# EAGLE design Sirokko (EAGLE 9.7.0)
Sirokko 262.01 controller: ESP32-S3, sensor interfaces, 12/24 V supply and relay outputs.

## Sheet 1 of 2: ESP32-S3 and sensor interfaces
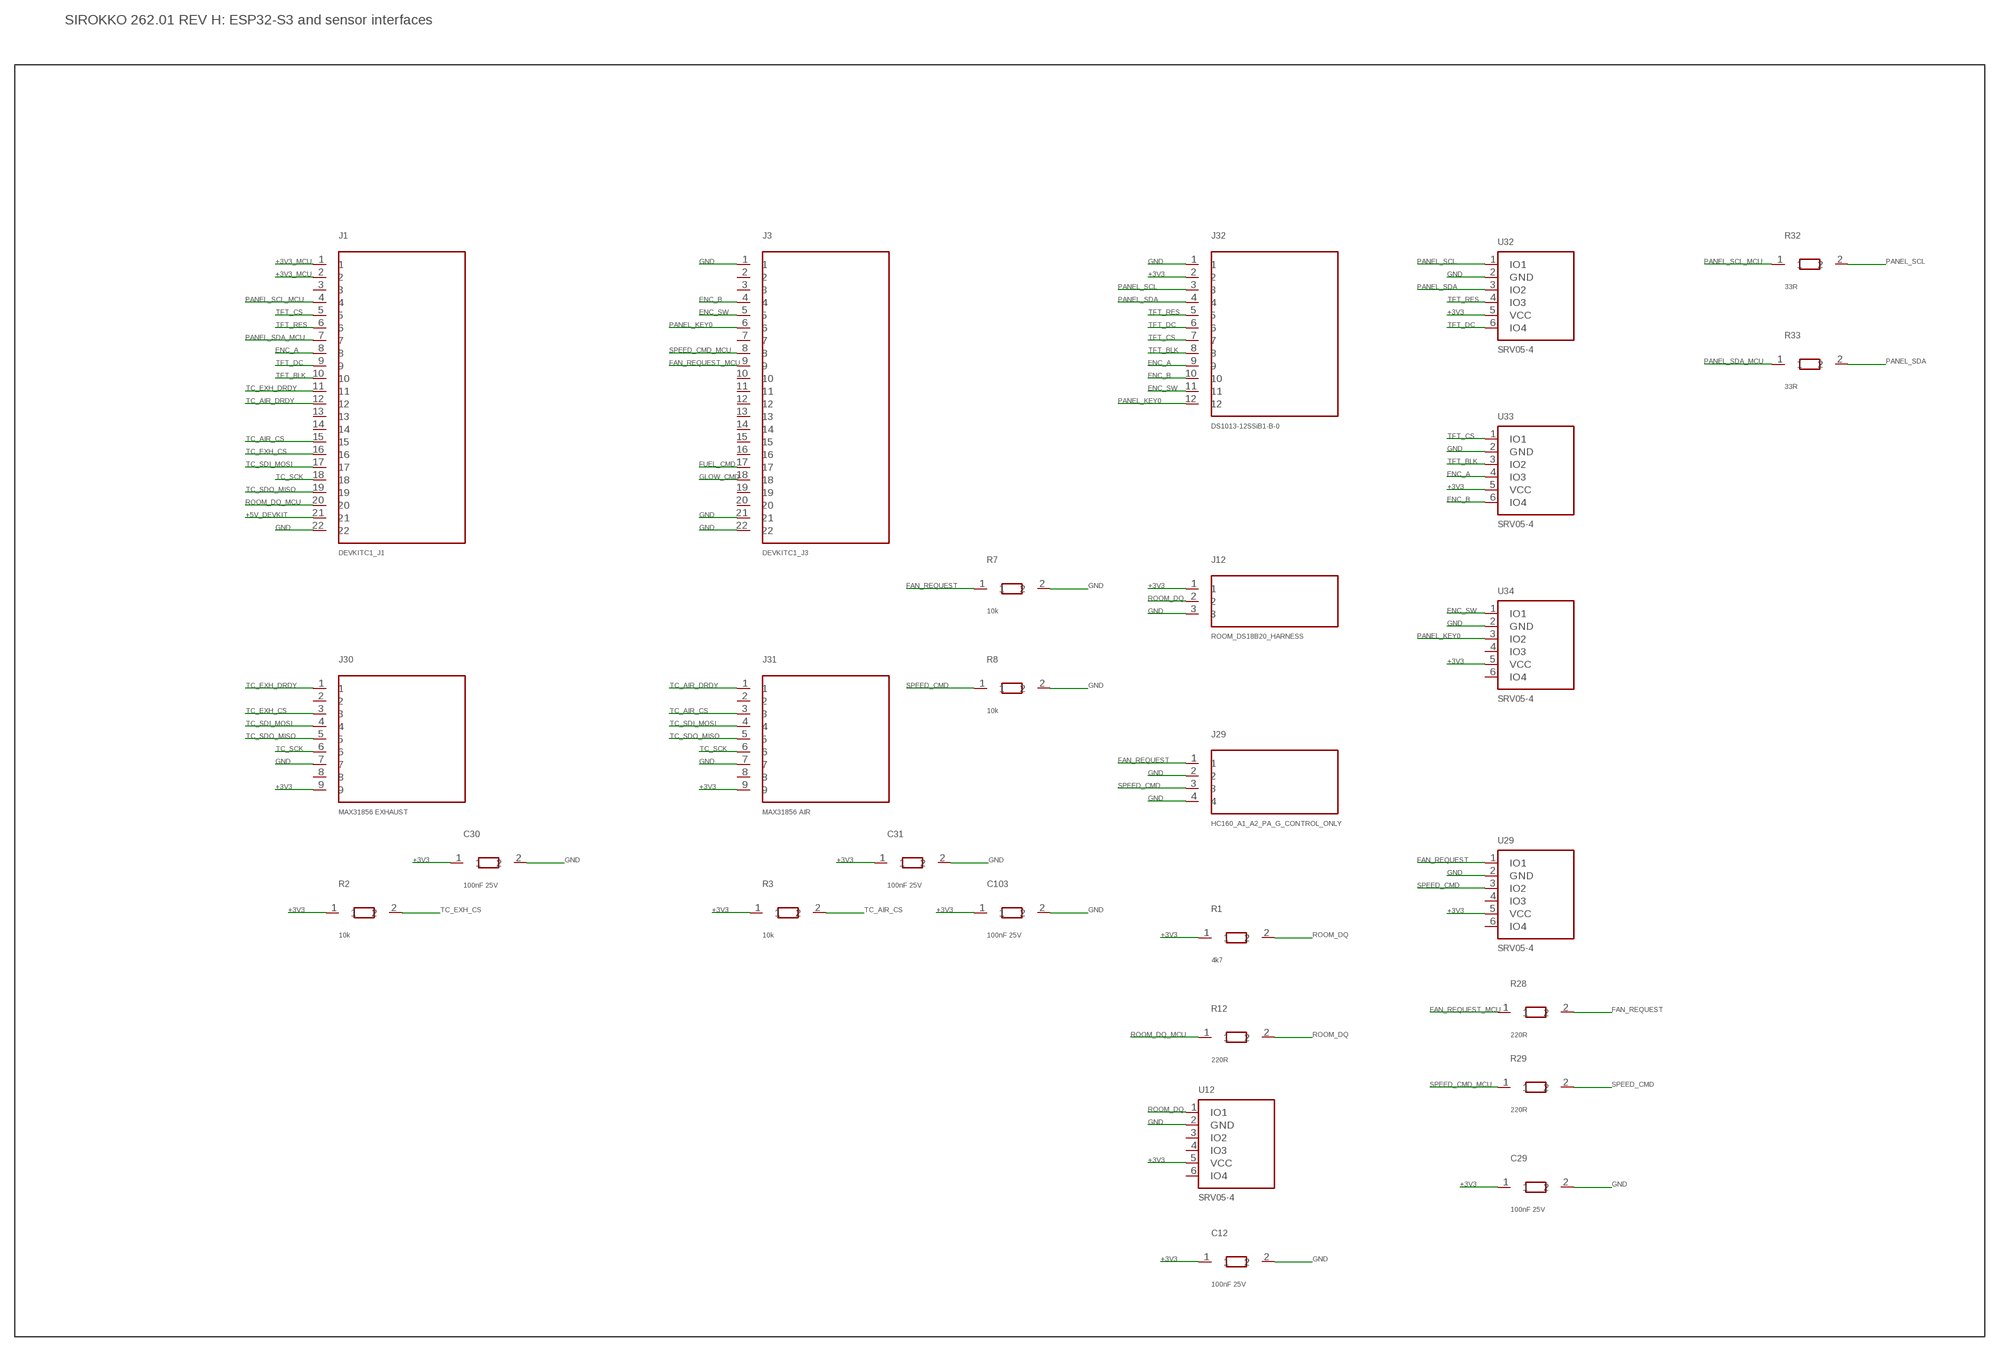
[diagram p0: schematic, sheet 1]

### Parts
C12  100nF 25V  C0805  [C0805]
C29  100nF 25V  C0805  [C0805]
C30  100nF 25V  C0805  [C0805]
C31  100nF 25V  C0805  [C0805]
C103  100nF 25V  C0805  [C0805]
J1  DEVKITC1_J1  CONN_22  [SOCKET_1X22_P2.54]
J3  DEVKITC1_J3  CONN_22  [SOCKET_1X22_P2.54]
J12  ROOM_DS18B20_HARNESS  CONN_3  [TERM_5.08_3]
J29  HC160_A1_A2_PA_G_CONTROL_ONLY  CONN_4  [TERM_5.08_4]
J30  MAX31856 EXHAUST  CONN_9  [SOCKET_MAX31856]
J31  MAX31856 AIR  CONN_9  [SOCKET_MAX31856]
J32  DS1013-12SSiB1-B-0  DS1013_12SSIB1  [DS1013_12SSIB1]
R1  4k7  R0805  [R0805]
R2  10k  R0805  [R0805]
R3  10k  R0805  [R0805]
R7  10k  R0805  [R0805]
R8  10k  R0805  [R0805]
R12  220R  R0805  [R0805]
R28  220R  R0805  [R0805]
R29  220R  R0805  [R0805]
R32  33R  R0805  [R0805]
R33  33R  R0805  [R0805]
U12  SRV05-4  SRV05  [SRV05_SOT23_6]
U29  SRV05-4  SRV05  [SRV05_SOT23_6]
U32  SRV05-4  SRV05  [SRV05_SOT23_6]
U33  SRV05-4  SRV05  [SRV05_SOT23_6]
U34  SRV05-4  SRV05  [SRV05_SOT23_6]

### Nets
+3V3: C12.1 C29.1 C30.1 C31.1 C103.1 J12.1 J30.9 J31.9 J32.2 R1.1 R2.1 R3.1 U12.5(VCC) U29.5(VCC) U32.5(VCC) U33.5(VCC) U34.5(VCC) ; also sheet 2
+3V3_MCU: J1.1 J1.2
+5V_DEVKIT: J1.21 ; also sheet 2
ENC_A: J1.8 J32.9 U33.4(IO3)
ENC_B: J3.4 J32.10 U33.6(IO4)
ENC_SW: J3.5 J32.11 U34.1(IO1)
FAN_REQUEST: J29.1 R7.1 R28.2 U29.1(IO1)
FAN_REQUEST_MCU: J3.9 R28.1
FUEL_CMD: J3.17 ; also sheet 2
GLOW_CMD: J3.18 ; also sheet 2
GND: C12.2 C29.2 C30.2 C31.2 C103.2 J1.22 J3.1 J3.21 J3.22 J12.3 J29.2 J29.4 J30.7 J31.7 J32.1 R7.2 R8.2 U12.2(GND) U29.2(GND) U32.2(GND) U33.2(GND) U34.2(GND) ; also sheet 2
PANEL_KEY0: J3.6 J32.12 U34.3(IO2)
PANEL_SCL: J32.3 R32.2 U32.1(IO1)
PANEL_SCL_MCU: J1.4 R32.1
PANEL_SDA: J32.4 R33.2 U32.3(IO2)
PANEL_SDA_MCU: J1.7 R33.1
ROOM_DQ: J12.2 R1.2 R12.2 U12.1(IO1)
ROOM_DQ_MCU: J1.20 R12.1
SPEED_CMD: J29.3 R8.1 R29.2 U29.3(IO2)
SPEED_CMD_MCU: J3.8 R29.1
TC_AIR_CS: J1.15 J31.3 R3.2
TC_AIR_DRDY: J1.12 J31.1
TC_EXH_CS: J1.16 J30.3 R2.2
TC_EXH_DRDY: J1.11 J30.1
TC_SCK: J1.18 J30.6 J31.6
TC_SDI_MOSI: J1.17 J30.4 J31.4
TC_SDO_MISO: J1.19 J30.5 J31.5
TFT_BLK: J1.10 J32.8 U33.3(IO2)
TFT_CS: J1.5 J32.7 U33.1(IO1)
TFT_DC: J1.9 J32.6 U32.6(IO4)
TFT_RES: J1.6 J32.5 U32.4(IO3)
Unconnected: J1.3 J1.13 J1.14 J3.2 J3.3 J3.7 J3.10 J3.11 J3.12 J3.13 J3.14 J3.15 J3.16 J3.19 J3.20 J30.2 J30.8 J31.2 J31.8 U12.3(IO2) U12.4(IO3) U12.6(IO4) U29.4(IO3) U29.6(IO4) U34.4(IO3) U34.6(IO4)

### Notes on the sheet
- SIROKKO 262.01 REV H: ESP32-S3 and sensor interfaces

## Sheet 2 of 2: Power supply and relay outputs
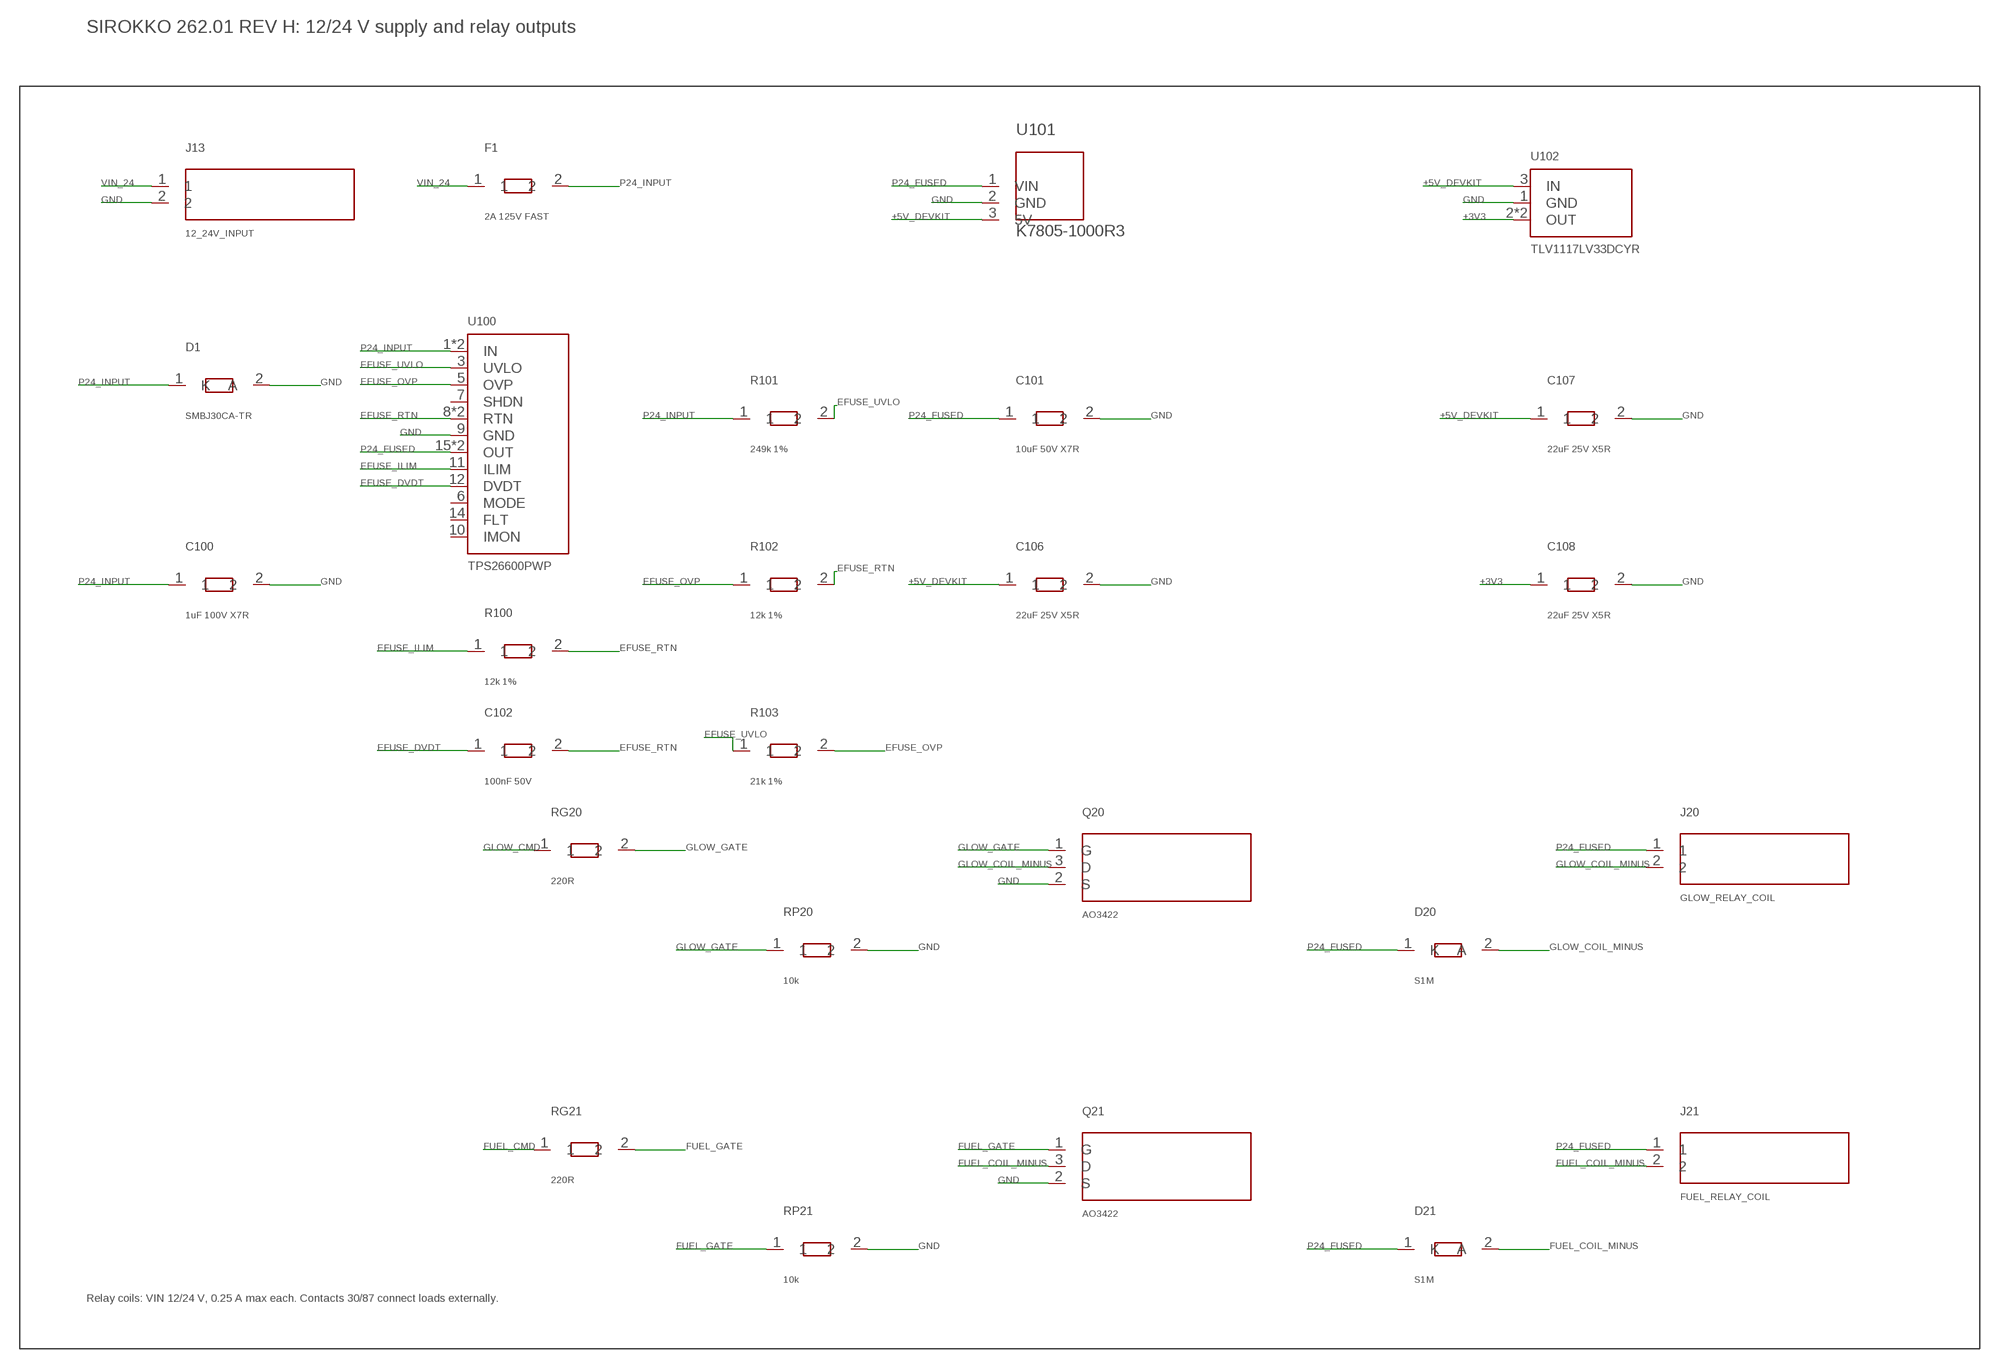
[diagram p1: schematic, sheet 2]

### Parts
C100  1uF 100V X7R  C1206  [C1206]
C101  10uF 50V X7R  C1210  [C1210]
C102  100nF 50V  C1206  [C1206]
C106  22uF 25V X5R  C1206  [C1206]
C107  22uF 25V X5R  C1206  [C1206]
C108  22uF 25V X5R  C1206  [C1206]
D1  SMBJ30CA-TR  SMB  [SMB]
D20  S1M  SMA  [SMA]
D21  S1M  SMA  [SMA]
F1  2A 125V FAST  FUSE2410  [FUSE2410]
J13  12_24V_INPUT  CONN_2  [TERM_5.08_2]
J20  GLOW_RELAY_COIL  CONN_2  [TERM_5.08_2]
J21  FUEL_RELAY_COIL  CONN_2  [TERM_5.08_2]
Q20  AO3422  [AO3422_SOT23]
Q21  AO3422  [AO3422_SOT23]
R100  12k 1%  R0805  [R0805]
R101  249k 1%  R0805  [R0805]
R102  12k 1%  R0805  [R0805]
R103  21k 1%  R0805  [R0805]
RG20  220R  R0805  [R0805]
RG21  220R  R0805  [R0805]
RP20  10k  R0805  [R0805]
RP21  10k  R0805  [R0805]
U100  TPS26600PWP  TPS26600  [TPS26600_PWP]
U101  K7805-1000R3  K7805_1000R3  [K7805_1000R3]
U102  TLV1117LV33DCYR  TLV1117LV33  [TLV1117LV_DCY]

### Nets
+3V3: C108.1 U102.2(OUT) U102.4(OUT) ; also sheet 1
+5V_DEVKIT: C106.1 C107.1 U101.3(5V) U102.3(IN) ; also sheet 1
EFUSE_DVDT: C102.1 U100.12(DVDT)
EFUSE_ILIM: R100.1 U100.11(ILIM)
EFUSE_OVP: R102.1 R103.2 U100.5(OVP)
EFUSE_RTN: C102.2 R100.2 R102.2 U100.8(RTN) U100.17(RTN)
EFUSE_UVLO: R101.2 R103.1 U100.3(UVLO)
FUEL_CMD: RG21.1 ; also sheet 1
FUEL_COIL_MINUS: D21.2(A) J21.2 Q21.3(D)
FUEL_GATE: Q21.1(G) RG21.2 RP21.1
GLOW_CMD: RG20.1 ; also sheet 1
GLOW_COIL_MINUS: D20.2(A) J20.2 Q20.3(D)
GLOW_GATE: Q20.1(G) RG20.2 RP20.1
GND: C100.2 C101.2 C106.2 C107.2 C108.2 D1.2(A) J13.2 Q20.2(S) Q21.2(S) RP20.2 RP21.2 U100.9(GND) U101.2(GND) U102.1(GND) ; also sheet 1
P24_FUSED: C101.1 D20.1(K) D21.1(K) J20.1 J21.1 U100.15(OUT) U100.16(OUT) U101.1(VIN)
P24_INPUT: C100.1 D1.1(K) F1.2 R101.1 U100.1(IN) U100.2(IN)
VIN_24: F1.1 J13.1
Unconnected: U100.6(MODE) U100.7(SHDN) U100.10(IMON) U100.14(FLT)

### Notes on the sheet
- SIROKKO 262.01 REV H: 12/24 V supply and relay outputs
- Relay coils: VIN 12/24 V, 0.25 A max each. Contacts 30/87 connect loads externally.

## Library data of the parts
C12 C29-C31 C103 = Sirokko:C0805; MPN: CC0805KRX7R8BB104; SUPPLIER_URL: https://www.chipdip.ru/product/0.1mkf-x7r-25v-10-0805-cc0805krx7r8bb104-kondensator-yageo-9000066545
C100 = Sirokko:C1206; MPN: CC1206KKX7R0BB105; SUPPLIER_URL: https://www.chipdip.ru/product/1mkf-x7r-100v-10-1206-cc1206kkx7r0bb105-kondensator-yageo-9000337923
C101 = Sirokko:C1210; MPN: GRM32ER71H106KA12L; SUPPLIER_URL: https://www.chipdip.ru/product/10mkf-x7r-50v-10-1210-grm32er71h106k-kondensator-murata-9000141173
C102 = Sirokko:C1206; MPN: CL31B104KBCNNNC; SUPPLIER_URL: https://www.chipdip.ru/product/0.1mkf-x7r-50v-10-1206-cl31b104kbcnnnc-kondensator-samsung-9000768544
C106-C108 = Sirokko:C1206; MPN: CL31A226KAHNNNE; SUPPLIER_URL: https://www.chipdip.ru/product/22mkf-x5r-25v-10-1206-cl31a226kahnnne-kondensator-samsung-9000413179
D1 = Sirokko:SMB; MPN: SMBJ30CA-TR; SUPPLIER_URL: https://www.chipdip.ru/product/smbj30ca-tr-diod-zaschitnyy-600vt-30v-st-microelectronics-9000484595
D20 D21 = Sirokko:SMA; MPN: S1M-13-F; SUPPLIER_URL: https://www.chipdip.ru/product/s1m-13-f-diod-vypryamitelnyy-1a-100v-sma-do-214ac-diodes-9000394670
F1 = Sirokko:FUSE2410; MPN: 0451002.MRL; SUPPLIER_URL: https://www.chipdip.ru/product/0451002-mrl-2a-125v-2410-predohranitel-smd-littelfuse-9000161728
J1 J3 = Sirokko:CONN_22; MPN: DS1023-1x40; SUPPLIER_URL: https://www.chipdip.ru/product/pbs-40-ds1023-1x40-gnezdo-na-platu-2.54mm-1x40pin-pryamoe-connfly-8935
J12 = Sirokko:CONN_3; MPN: DG127-5.08-03P-14-1000Z(H); SUPPLIER_URL: https://www.chipdip.ru/product/dg127-5.08-03p-14-1000z-h-klemmnik-dg127-5.08-degson-8076133255
J13 J20 J21 = Sirokko:CONN_2; MPN: DG127-5.08-02P-14-00A(H); SUPPLIER_URL: https://www.chipdip.ru/product/dg127-5.08-02p-14-00a-h-klemmnik-degson-8007163023
J29 = Sirokko:CONN_4; MPN: DG127-5.08-02P-14-00A(H); SUPPLIER_URL: https://www.chipdip.ru/product/dg127-5.08-02p-14-00a-h-klemmnik-degson-8007163023
J30 J31 = Sirokko:CONN_9; MPN: DS1023-1x40; SUPPLIER_URL: https://www.chipdip.ru/product/pbs-40-ds1023-1x40-gnezdo-na-platu-2.54mm-1x40pin-pryamoe-connfly-8935
J32 = Sirokko-parts:DS1013_12SSIB1; MPN: DS1013-12SSiB1-B-0; SUPPLIER_URL: https://www.chipdip.ru/product/idc-12m-ds1013-12-vilka-2.54mm-na-platu-12pin-connfly-9000386091
Q20 Q21 = Sirokko-parts:AO3422; MPN: AO3422; SUPPLIER_URL: https://www.chipdip.ru/product/ao3422-tranzistor-n-mosfet-55v-2.1a-1.25vt-alpha-omega-9000604823
R1 = Sirokko:R0805; MPN: RC0805FR-074K7L; SUPPLIER_URL: https://www.chipdip.ru/product/0.125vt-0805-4.7-kom-1-rc0805fr-074k7l-chip-rezistor-yageo-9000350078
R2 R3 R7 R8 RP20 RP21 = Sirokko:R0805; MPN: RC0805FR-0710KL; SUPPLIER_URL: https://www.chipdip.ru/product/0.125vt-0805-10-kom-1-rc0805fr-0710kl-chip-rezistor-yageo-9000272499
R12 R28 R29 RG20 RG21 = Sirokko:R0805; MPN: RC0805FR-07220RL; SUPPLIER_URL: https://www.chipdip.ru/product/0.125vt-0805-220-om-1-rc0805fr-07220rl-chip-rezistor-yageo-9000393930
R32 R33 = Sirokko:R0805; MPN: RC0805FR-0733RL; SUPPLIER_URL: https://www.chipdip.ru/product/rc0805fr-0733rl-yageo-8001790284
R100 R102 = Sirokko:R0805; MPN: RC0805FR-0712KL; SUPPLIER_URL: https://www.chipdip.ru/product/0.125vt-0805-12-kom-1-rc0805fr-0712kl-chip-rezistor-yageo-9001512277
R101 = Sirokko:R0805; MPN: RC0805FR-07249KL; SUPPLIER_URL: https://www.chipdip.ru/product/rc0805fr-07249kl-rezistor-yageo-9000374189
R103 = Sirokko:R0805; MPN: RC0805FR-0721KL; SUPPLIER_URL: https://www.chipdip.ru/product/rc0805fr-0721kl-yageo-8001794514
U12 U29 U32-U34 = Sirokko-parts:SRV05; DATASHEET: https://static.chipdip.ru/lib/303/DOC021303379.pdf; MPN: SRV05-4.TCT; SUPPLIER_URL: https://www.chipdip.ru/product/srv05-4-tct-ustroystvo-zaschity-usb-ot-esd-sborka-umw-9001106217
U100 = Sirokko-parts:TPS26600; DATASHEET: https://www.ti.com/lit/ds/symlink/tps2660.pdf; MPN: TPS26600PWP; SUPPLIER_URL: https://www.chipdip.ru/product/tps26600pwp-texas-instruments-8003870507
U101 = Sirokko-parts:K7805_1000R3; MPN: K7805-1000R3; SUPPLIER_URL: https://www.chipdip.ru/product/k7805-1000r3-dc-dc-preobrazovatel-5vt-vhod-8-36v-mornsun-9000541503
U102 = Sirokko-parts:TLV1117LV33; DATASHEET: https://www.ti.com/lit/ds/symlink/tlv1117lv.pdf; MPN: TLV1117LV33DCYR; SUPPLIER_URL: https://www.chipdip.ru/product/tlv1117lv33dcyr-stabilizator-texas-instruments-9001599934

## Net classes
0 Default: width 0.2 mm, drill 0.3 mm, clearance 0.2 mm

## Board
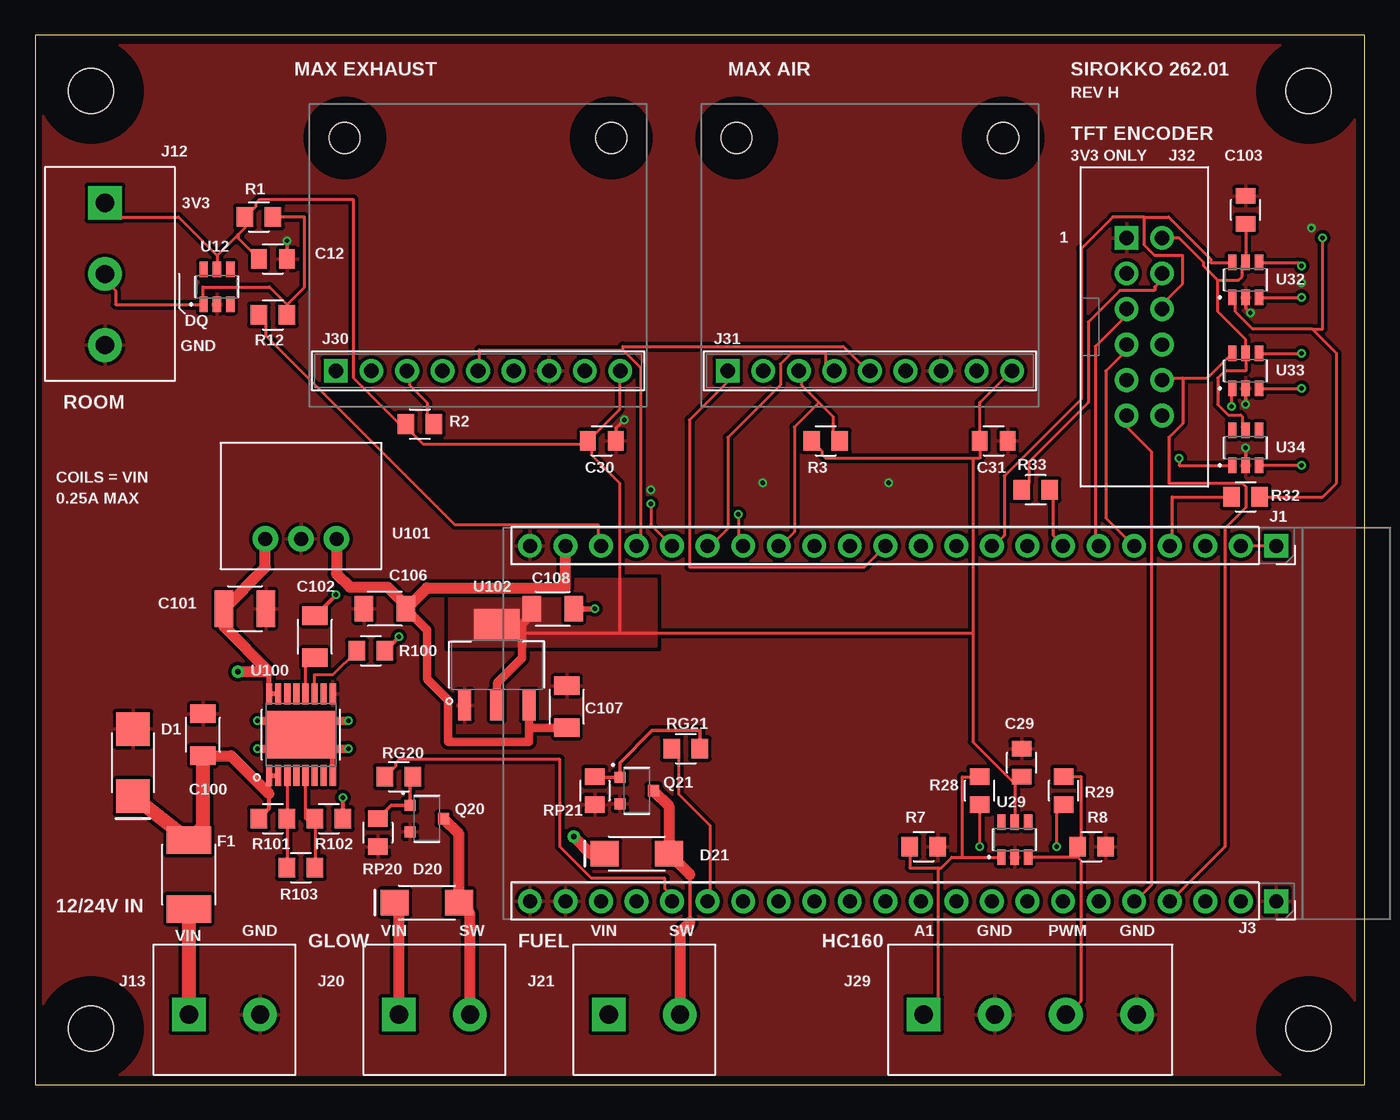
[diagram p2: board, top side]
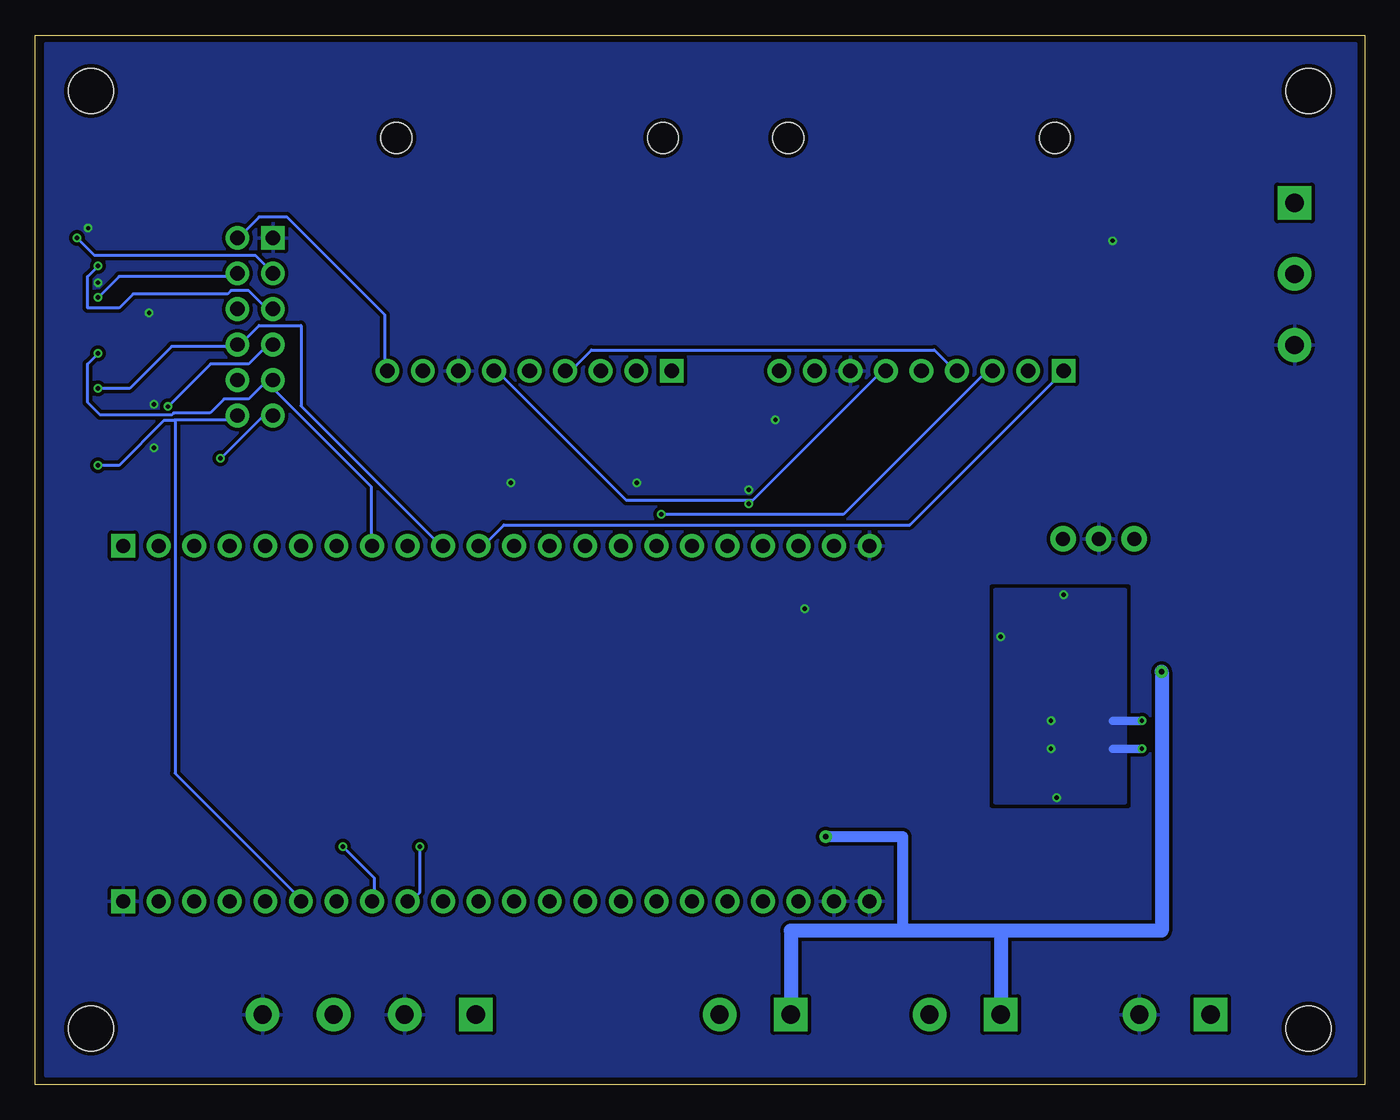
[diagram p3: board, bottom side, seen from below]

Size 95 x 75 mm. Coordinates in mm from the lower left corner, seen from the top.
Outline: 0,0 95,0 95,75 0,75 0,0
Copper layers (1*16): Top 0.035mm / dielectric 1.5mm / Bottom 0.035mm
Design rules "Sirokko.edru": minimum track width 0.2mm, minimum drill 0.3mm, track to track 0.2mm, track to pad 0.2mm, pad to pad 0.2mm, via to via 0.2mm, smd to smd 0.2mm, copper to edge 0.3mm, drill to drill 0.25mm, minimum pad ring 0.1mm, minimum via ring 0.15mm, stop-mask expansion 0.04mm, vias tented up to drill 32mil, thermal gap 10mil
Holes 3.2 mm at 91,4 4,71 91,71 4,4
Holes 2.2 mm at 22.14,67.64 41.19,67.64 50.13,67.64 69.19,67.64
tRestrict: area 87.5,0.5 to 94.5,7.5; area 0.5,67.5 to 7.5,74.5; area 87.5,67.5 to 94.5,74.5; area 19.4,64.9 to 24.8,70.3; area 38.5,64.9 to 43.9,70.3; area 47.4,64.9 to 52.8,70.3; area 66.5,64.9 to 71.9,70.3; area 0.5,0.5 to 7.5,7.5
vRestrict: area 87.5,0.5 to 94.5,7.5; area 0.5,67.5 to 7.5,74.5; area 87.5,67.5 to 94.5,74.5; area 19.4,64.9 to 24.8,70.3; area 38.5,64.9 to 43.9,70.3; area 47.4,64.9 to 52.8,70.3; area 66.5,64.9 to 71.9,70.3; area 0.5,0.5 to 7.5,7.5

### Footprints (pad centres in the part's own frame; a part is rotated, then mirrored left to right if it is on the bottom)
C0805 = smd 1.1 x 1.4: 1 -1,0; 2 1,0
C1206 = smd 1.3 x 1.8: 1 -1.5,0; 2 1.5,0
C1210 = smd 1.3 x 2.6: 1 -1.5,0; 2 1.5,0
SMB = smd 2.4 x 2.4: 1 -2.4,0; 2 2.4,0
SMA = smd 2 x 1.8: 1 -2.3,0; 2 2.3,0
FUSE2410 = smd 1.96 x 3.15: 1 -2.455,0; 2 2.455,0
SOCKET_1X22_P2.54 = drill 1 pad 1.7 square: 1 0,0 | drill 1 pad 1.7: 2 0,-2.54; 3 0,-5.08; 4 0,-7.62; 5 0,-10.16; 6 0,-12.7; 7 0,-15.24; 8 0,-17.78; 9 0,-20.32; 10 0,-22.86; 11 0,-25.4; 12 0,-27.94; 13 0,-30.48; 14 0,-33.02; 15 0,-35.56; 16 0,-38.1; 17 0,-40.64; 18 0,-43.18; 19 0,-45.72; 20 0,-48.26; 21 0,-50.8; 22 0,-53.34
TERM_5.08_3 = drill 1.3 pad 2.4 square: 1 0,0 | drill 1.3 pad 2.4: 2 5.08,0; 3 10.16,0
TERM_5.08_2 = drill 1.3 pad 2.4 square: 1 0,0 | drill 1.3 pad 2.4: 2 5.08,0
TERM_5.08_4 = drill 1.3 pad 2.4 square: 1 0,0 | drill 1.3 pad 2.4: 2 5.08,0; 3 10.16,0; 4 15.24,0
SOCKET_MAX31856 = drill 1.04 pad 1.7 square: 1 0,0 | drill 1.04 pad 1.7: 2 0,-2.54; 3 0,-5.08; 4 0,-7.62; 5 0,-10.16; 6 0,-12.7; 7 0,-15.24; 8 0,-17.78; 9 0,-20.32
DS1013_12SSIB1 = drill 1.02 pad 1.7 square: 1 0,0 | drill 1.02 pad 1.7: 2 2.54,0; 3 0,-2.54; 4 2.54,-2.54; 5 0,-5.08; 6 2.54,-5.08; 7 0,-7.62; 8 2.54,-7.62; 9 0,-10.16; 10 2.54,-10.16; 11 0,-12.7; 12 2.54,-12.7
AO3422_SOT23 = smd 0.8 x 0.8: 1 -1.2,0.95; 2 -1.2,-0.95; 3 1.2,0
R0805 = smd 1.2 x 1.4: 1 -1,0; 2 1,0
SRV05_SOT23_6 = smd 0.6 x 1.1: 1 -0.95,-1.25; 2 0,-1.25; 3 0.95,-1.25; 4 0.95,1.25; 5 0,1.25; 6 -0.95,1.25
TPS26600_PWP = smd 1.5 x 0.45: 1 -2.9,2.275; 2 -2.9,1.625; 3 -2.9,0.975; 4 -2.9,0.325; 5 -2.9,-0.325; 6 -2.9,-0.975; 7 -2.9,-1.625; 8 -2.9,-2.275; 9 2.9,-2.275; 10 2.9,-1.625; 11 2.9,-0.975; 12 2.9,-0.325; 13 2.9,0.325; 14 2.9,0.975; 15 2.9,1.625; 16 2.9,2.275 | smd 3.4 x 5: 17 0,0
K7805_1000R3 = drill 1 pad 1.8: 1 -2.54,0; 2 0,0; 3 2.54,0
TLV1117LV_DCY = smd 0.95 x 2.15: 1 -2.3,-2.9; 2 0,-2.9; 3 2.3,-2.9 | smd 3.25 x 2.15: 4 0,2.9

### Placement (x,y rotation side)
C12  17,59 0 top
C29  70.5,23 90 top
C30  40.5,46 0 top
C31  68.5,46 0 top
C100  12,25 90 top
C101  15,34 0 top
C102  20,32 90 top
C103  86.5,62.5 90 top
C106  25,34 180 top
C107  38,27 90 top
C108  37,34 0 top
D1  7,23 90 top
D20  28,13 0 top
D21  43,16.5 0 top
F1  11,15 90 top
J1  88.7,38.5 270 top
J3  88.7,13.1 270 top
J12  5,63 270 top
J13  11,5 0 top
J20  26,5 0 top
J21  41,5 0 top
J29  63.5,5 0 top
J30  21.5,51 90 top
J31  49.5,51 90 top
J32  78,60.5 0 top
Q20  28,19 0 top
Q21  43,21 0 top
R1  16,62 0 top
R2  27.5,47.2 0 top
R3  56.5,46 0 top
R7  63.5,17 0 top
R8  75.5,17 0 top
R12  17,55 0 top
R28  67.5,21 90 top
R29  73.5,21 90 top
R32  86.5,42 0 top
R33  71.5,42.5 180 top
R100  24,31 0 top
R101  17,19 0 top
R102  21,19 0 top
R103  19,15.5 0 top
RG20  26,22 0 top
RG21  46.5,24 0 top
RP20  24.5,18 270 top
RP21  40,21 270 top
U12  13,57 0 top
U29  70,17.5 0 top
U32  86.5,57.5 0 top
U33  86.5,51 0 top
U34  86.5,45.5 0 top
U100  19,25 90 top
U101  19,39 0 top
U102  33,30 0 top

### Tracks (layer width: path | path; a pad name or v marks a point on that pad's centre or on a via)
+3V3
  Top 0.2: 13,59.25 U12.5 | 14.5,60.75 15,61.25 R1.1 15.75,62.75 15.75,63 16,63.25 22.75,63.25 22.75,50.5 26,47.25 26.5,47.25 R2.1 26.5,47 27.75,45.75 39.5,45.75 C30.1 39.75,46.25 | 14.5,60.75 13,59.25 | C12.1 14.5,60.5 14.5,60.75 | 13,59.25 10.25,62 5,62 J12.1 | 39.75,46.25 41.75,48.25 41.75,51 J30.9 | 41.75,32.25 34.8,32.25 | 41.75,32.25 41.75,43 39.75,45 39.75,46.25 | C103.1 U32.5 86.25,58.5 86.25,57.75 86,57.5 84.5,57.5 | U34.5 86.25,47 86.25,47.75 86.15,47.85 85.25,47.85 84.5,48.6 84.5,50.5 85,51 86.5,51 U33.5 86.5,53.25 84.5,55.25 84.5,57.5 | J32.2 81.75,60.5 83.5,58.75 83.5,58.5 84.5,57.5 | 70,21.5 U29.5 | R3.1 56.25,45.25 56.25,45 56.5,44.75 67,44.75 | 67,44.75 67.5,44.75 C31.1 67.5,48.75 69.75,51 J31.9 | 70,21.5 67,24.5 67,32.25 | 67,44.75 67,32.25 | 70,21.5 C29.1 | 67,32.25 41.75,32.25
  Top 0.6: U102.2 33,28.7 34.8,30.5 34.8,32.25 34.8,32.9 | 34.8,32.9 U102.4 | 34.8,32.9 35.5,33.6 C108.1
  Bottom 0.2: J32.2 80.5,60.5 79,62 77,62 70,55 70,51 J31.9
  pour Top (isolate 0.25, no thermals): 29.62,31.32 44.38,31.32 44.38,36.08 29.62,36.08
+3V3_MCU
  Top 0.2: J1.1 J1.2
+5V_DEVKIT
  Top 0.6: C106.1 28,32.5 28,29 29.5,27.5 29.5,24.5 35.3,24.5 35.3,25.5 | 35.3,25.5 U102.3 | 35.3,25.5 C107.1
  Top 0.8: U101.3 21.54,36.5 22.5,35.54 25.2,35.54 26.5,34.24 C106.1 28,35.5 37.9,35.5 J1.21
EFUSE_DVDT
  Top 0.2: U100.12 19.32,29.82 C102.1
EFUSE_ILIM
  Top 0.2: U100.11 19.98,29.3 21.3,29.3 R100.1
EFUSE_OVP
  Top 0.2: U100.5 19.32,19 R102.1 R103.2
EFUSE_RTN  (via drill 0.3 pad 0.6)
  Top 0.3: R102.2 v22,20.5 | R100.2 v26,32 | C102.2 v21.5,35
  Top 0.35: U100.8 21.27,25 U100.17
  Top 0.6: v15.9,24 18,24 U100.17 | v15.9,26 18,26 U100.17 | v22.4,24 20,24 U100.17 | v22.4,26 20,26 U100.17
  Bottom 0.6: v15.9,24 18,24 | v15.9,26 18,26
  pour Bottom (isolate 0.3, no thermals): 17.1,20.1 26.4,20.1 26.4,35.4 17.1,35.4
EFUSE_UVLO
  Top 0.2: U100.3 18.02,19.02 R101.2 R103.1
ENC_A  (via drill 0.3 pad 0.6)
  Top 0.2: U33.4 v90.5,52.25
  Bottom 0.2: 78.5,50.25 79.75,49 81.5,49 82.5,48 85.1,48 85.25,47.85 90.35,47.85 91.25,48.75 91.25,51.5 v90.5,52.25 | 78.5,50.25 78,50.25 J32.9 78.5,50.25 | 78.5,50.25 71,42.75 71,38.5 J1.8
ENC_B
  Top 0.2: 82,50.5 80.75,50.5 J32.10 | 82,50.5 83.75,50.5 85.5,52.25 U33.6 | 82,50.5 82,47.25 81,46.25 81,43 86.25,43 86.5,42.75 86.5,41.25 85,39.75 85,17 81.25,13.25 J3.4
ENC_SW  (via drill 0.3)
  Top 0.2: U34.1 81.75,44.25 v81.75,44.75 | J32.11 78,47 79.75,45.25 79.75,14.25 78.75,13.25 J3.5
  Bottom 0.2: v81.75,44.75 78.75,47.75 78,47.75 J32.11
FAN_REQUEST
  Top 0.2: 66.25,16.25 65.5,16.25 64.75,15.5 64.5,15.5 | 66.25,16.25 U29.1 | 64.5,15.5 62.5,15.5 R7.1 | R28.2 66.25,22 66.25,16.25 | J29.1 64.5,6 64.5,15.5
FAN_REQUEST_MCU  (via drill 0.3)
  Top 0.2: v67.5,17 R28.1
  Bottom 0.2: v67.5,17 67.5,13.75 68,13.25 68.25,13.25 J3.9
FUEL_CMD
  Top 0.2: RG21.1 46,23.5 46,20.75 48.25,18.5 48.25,13.25 J3.17
FUEL_COIL_MINUS
  Top 0.25: 46.79,15.01 46.79,11.6
  Top 0.8: Q21.3 45.3,19.9 D21.2 46.79,15.01 | 46.79,11.6 46.08,10.89 J21.2
FUEL_GATE
  Top 0.25: RG21.2 47.5,25.3 44.1,25.3 41.8,23 Q21.1 40.05,21.95 RP21.1
GLOW_CMD
  Top 0.2: RG20.1 25.75,22.75 25.75,23 26,23.25 37.5,23.25 37.5,17 39.75,14.75 45,14.75 45,14 45.5,13.5 45.5,13.25 J3.18
GLOW_COIL_MINUS
  Top 0.8: J20.2 31.08,12.22 D20.2 30.3,17.9 Q20.3
GLOW_GATE
  Top 0.25: RG20.2 26.8,21.8 Q20.1 25.45,19.95 RP20.1
GND  (via drill 0.3 pad 0.6)
  Top 0.25: C30.2 41.5,46.9 v42.1,47.5 | C12.2 v18,60.3 | U32.2 86.5,55.5 v86.85,55.15 | U33.2 v86.5,48.6 | U34.2 v86.5,45.5
  Top 0.4: C108.2 v40,34
  other vias: 44,42.5 52,43 91.2,61.2 90.5,57.3 61,43
  pour Top (isolate 0.25, rank 2): 0.62,0.75 94.25,0.75 94.25,74.25 0.62,74.25
  pour Bottom (isolate 0.25, rank 2): 0.62,0.62 94.25,0.62 94.25,74.38 0.62,74.38
P24_FUSED  (via drill 0.4 pad 0.9)
  Top 0.35: U100.15 U100.16 16.73,29.5
  Top 0.8: U101.1 16.46,36.96 C101.1 13.5,32.73 16.73,29.5 v14.5,29.5 | v38.5,17.7 39.7,16.5 D21.1 | J20.1 26,12.7 D20.1
  Bottom 0.8: 33,11 33,17.7 v38.5,17.7
  Bottom 1: v14.5,29.5 14.5,11 26,11 | 26,11 33,11 41,11 J21.1 | 26,11 J20.1
P24_INPUT
  Top 0.3: R101.1 16.73,19.73 16.73,20.77
  Top 0.35: 16.73,20.77 U100.1 U100.2
  Top 0.8: C100.1 14,23.5 16.73,20.77
  Top 1: D1.1 F1.2 12,18.45 C100.1
PANEL_KEY0  (via drill 0.3 pad 0.6)
  Top 0.2: v90.5,44.25 U34.3
  Bottom 0.2: 85,47.5 81,47.5 80.75,47.75 J32.12 | 85,47.5 85,22.25 76,13.25 J3.6 | v90.5,44.25 89,44.25 85.8,47.45 85.09,47.45 85.04,47.5 85,47.5
PANEL_SCL  (via drill 0.3 pad 0.6)
  Top 0.2: U32.1 85.75,56.25 85.75,55.25 87,54 91.25,54 | R32.2 92,42 93,43 93,52.25 91.25,54 | 91.25,54 92,54 v92,60.5
  Bottom 0.2: J32.3 78,58 79.25,59.25 90.75,59.25 v92,60.5
PANEL_SCL_MCU
  Top 0.2: J1.4 81.25,38.5 81.25,42 R32.1
PANEL_SDA  (via drill 0.3 pad 0.6)
  Top 0.2: J32.4 80.5,57.75 80.5,57.5 80,57 80,56.75 77.5,56.75 75.25,54.5 75.25,48.75 71,44.5 71,43 R33.2 | U32.3 v90.5,56.25
  Bottom 0.2: J32.4 80.75,57.75 89,57.75 v90.5,56.25
PANEL_SDA_MCU
  Top 0.2: J1.7 73.25,38.5 73.25,38.75 72.75,39.25 72.75,42.25 R33.1
ROOM_DQ
  Top 0.2: R1.2 19.25,62 19.25,57 18,55.75 | R12.2 18,55.75 | 12,55.75 5.75,55.75 5.75,56.75 5,57.5 J12.2 | 18,55.75 16.75,57 12,57 12,55.75 | 12,55.75 U12.1
ROOM_DQ_MCU
  Top 0.2: R12.1 16.5,54.5 16.5,53.5 30,40 40.25,40 40.25,38.5 J1.20
SPEED_CMD
  Top 0.2: 74.5,16.25 U29.3 | 74.5,16.25 R8.1 74.75,17.25 74.75,22 R29.2 | 74.5,16.25 74.75,16 74.75,6 73.75,5 J29.3
SPEED_CMD_MCU  (via drill 0.3)
  Top 0.2: R29.1 73,19.5 v73,17
  Bottom 0.2: v73,17 70.75,14.75 70.75,13.25 J3.8
TC_AIR_CS
  Top 0.2: R3.2 57,46.5 57,47.75 56,48.75 | 56,48.75 54.75,50 54.75,51 J31.3 | 56,48.75 54.25,47 54.25,39.5 53.25,38.5 J1.15
TC_AIR_DRDY
  Top 0.2: J31.1 49.5,50.25 46.75,47.5 46.75,37 59.25,37 J1.12
TC_EXH_CS  (via drill 0.3)
  Top 0.2: R2.2 28.5,47.25 28,47.75 28,48.75 26.75,50 26.75,51 J30.3 | v50.25,40.75 50.25,38.75 50.5,38.5 J1.16
  Bottom 0.2: v50.25,40.75 37.25,40.75 27,51 J30.3
TC_EXH_DRDY
  Bottom 0.2: J30.1 32.5,40 61.5,40 63,38.5 J1.11
TC_SCK  (via drill 0.3)
  Top 0.2: v44,41.5 44,40 45.5,38.5 J1.18
  Bottom 0.2: 43.75,41.75 34.5,51 J30.6 | 43.75,41.75 v44,41.5 | 43.75,41.75 52.75,41.75 62,51 J31.6
TC_SDI_MOSI
  Top 0.2: J1.17 48.25,38.5 49.5,39.75 49.5,46.25 53.25,50 53.25,51.5 54,52.25 56.5,52.25 56.5,51.5 57,51 J31.4
  Bottom 0.2: J31.4 56.75,51 55.25,52.5 30.75,52.5 29.25,51 J30.4
TC_SDO_MISO
  Top 0.2: 42,52.5 43.25,51.25 43.25,38.75 43,38.5 J1.19 | 42,52.5 31.75,52.5 31.75,51 J30.5 | 42,52.5 42,52.75 57.75,52.75 59.5,51 J31.5
TFT_BLK  (via drill 0.3 pad 0.6)
  Top 0.2: U33.3 v90.5,49.75
  Bottom 0.2: J1.10 66,38.5 76,48.5 76,54.25 79,54.25 80.25,53 80.5,53 J32.8 80.75,52.75 85.25,52.75 88.25,49.75 v90.5,49.75
TFT_CS  (via drill 0.3)
  Top 0.2: v85.5,48.45 85.5,49.75 U33.1 | J32.7 78,52.5 76.5,51 76.5,40.5 78.5,38.5 J1.5
  Bottom 0.2: v85.5,48.45 82.45,51.5 79.75,51.5 78.5,52.75 78,52.75 J32.7
TFT_DC
  Top 0.2: U32.6 84,58.75 84,59 81,62 79.25,62 | 79.25,62 79.25,60 80,59.25 82,59.25 82,57.25 80.75,56 80.75,55.5 J32.6 | 79.25,62 77,62 74.75,59.75 74.75,49 69.25,43.5 69.25,39.25 68.5,38.5 J1.9
TFT_RES  (via drill 0.3 pad 0.6)
  Top 0.2: J1.6 75.75,38.75 75.75,52.75 78,55 J32.5 | U32.4 90.25,58.75 v90.5,58.5
  Bottom 0.2: J32.5 78,55.5 78.5,55.5 79.75,56.75 81,56.75 81.25,56.5 88,56.5 89,55.5 91.25,55.5 91.25,57.75 v90.5,58.5
VIN_24
  Top 1: J13.1 F1.1

### Text on the board
tPlace: MAX EXHAUST | MAX AIR | SIROKKO 262.01 | REV H | TFT ENCODER | 3V3 ONLY | 3V3 | 1 | DQ | GND | ROOM | COILS = VIN | 0.25A MAX | 12/24V IN | GND | VIN | SW | VIN | SW | A1 | GND | PWM | GND | VIN | GLOW | FUEL | HC160